# EasyEDA Pro project esp32‑smart‑greenhouse.epro

# Schematic schematic1_1
Board Name: Board1; Create Date: 2025-07-08; Page Name: P1; Project Name: ESP32-01-V1.05; Schematic Name: schematic1_1; Update Date: 2025-07-08; Company: 嘉立创EDA; Page Size: A4; Version: V1.0
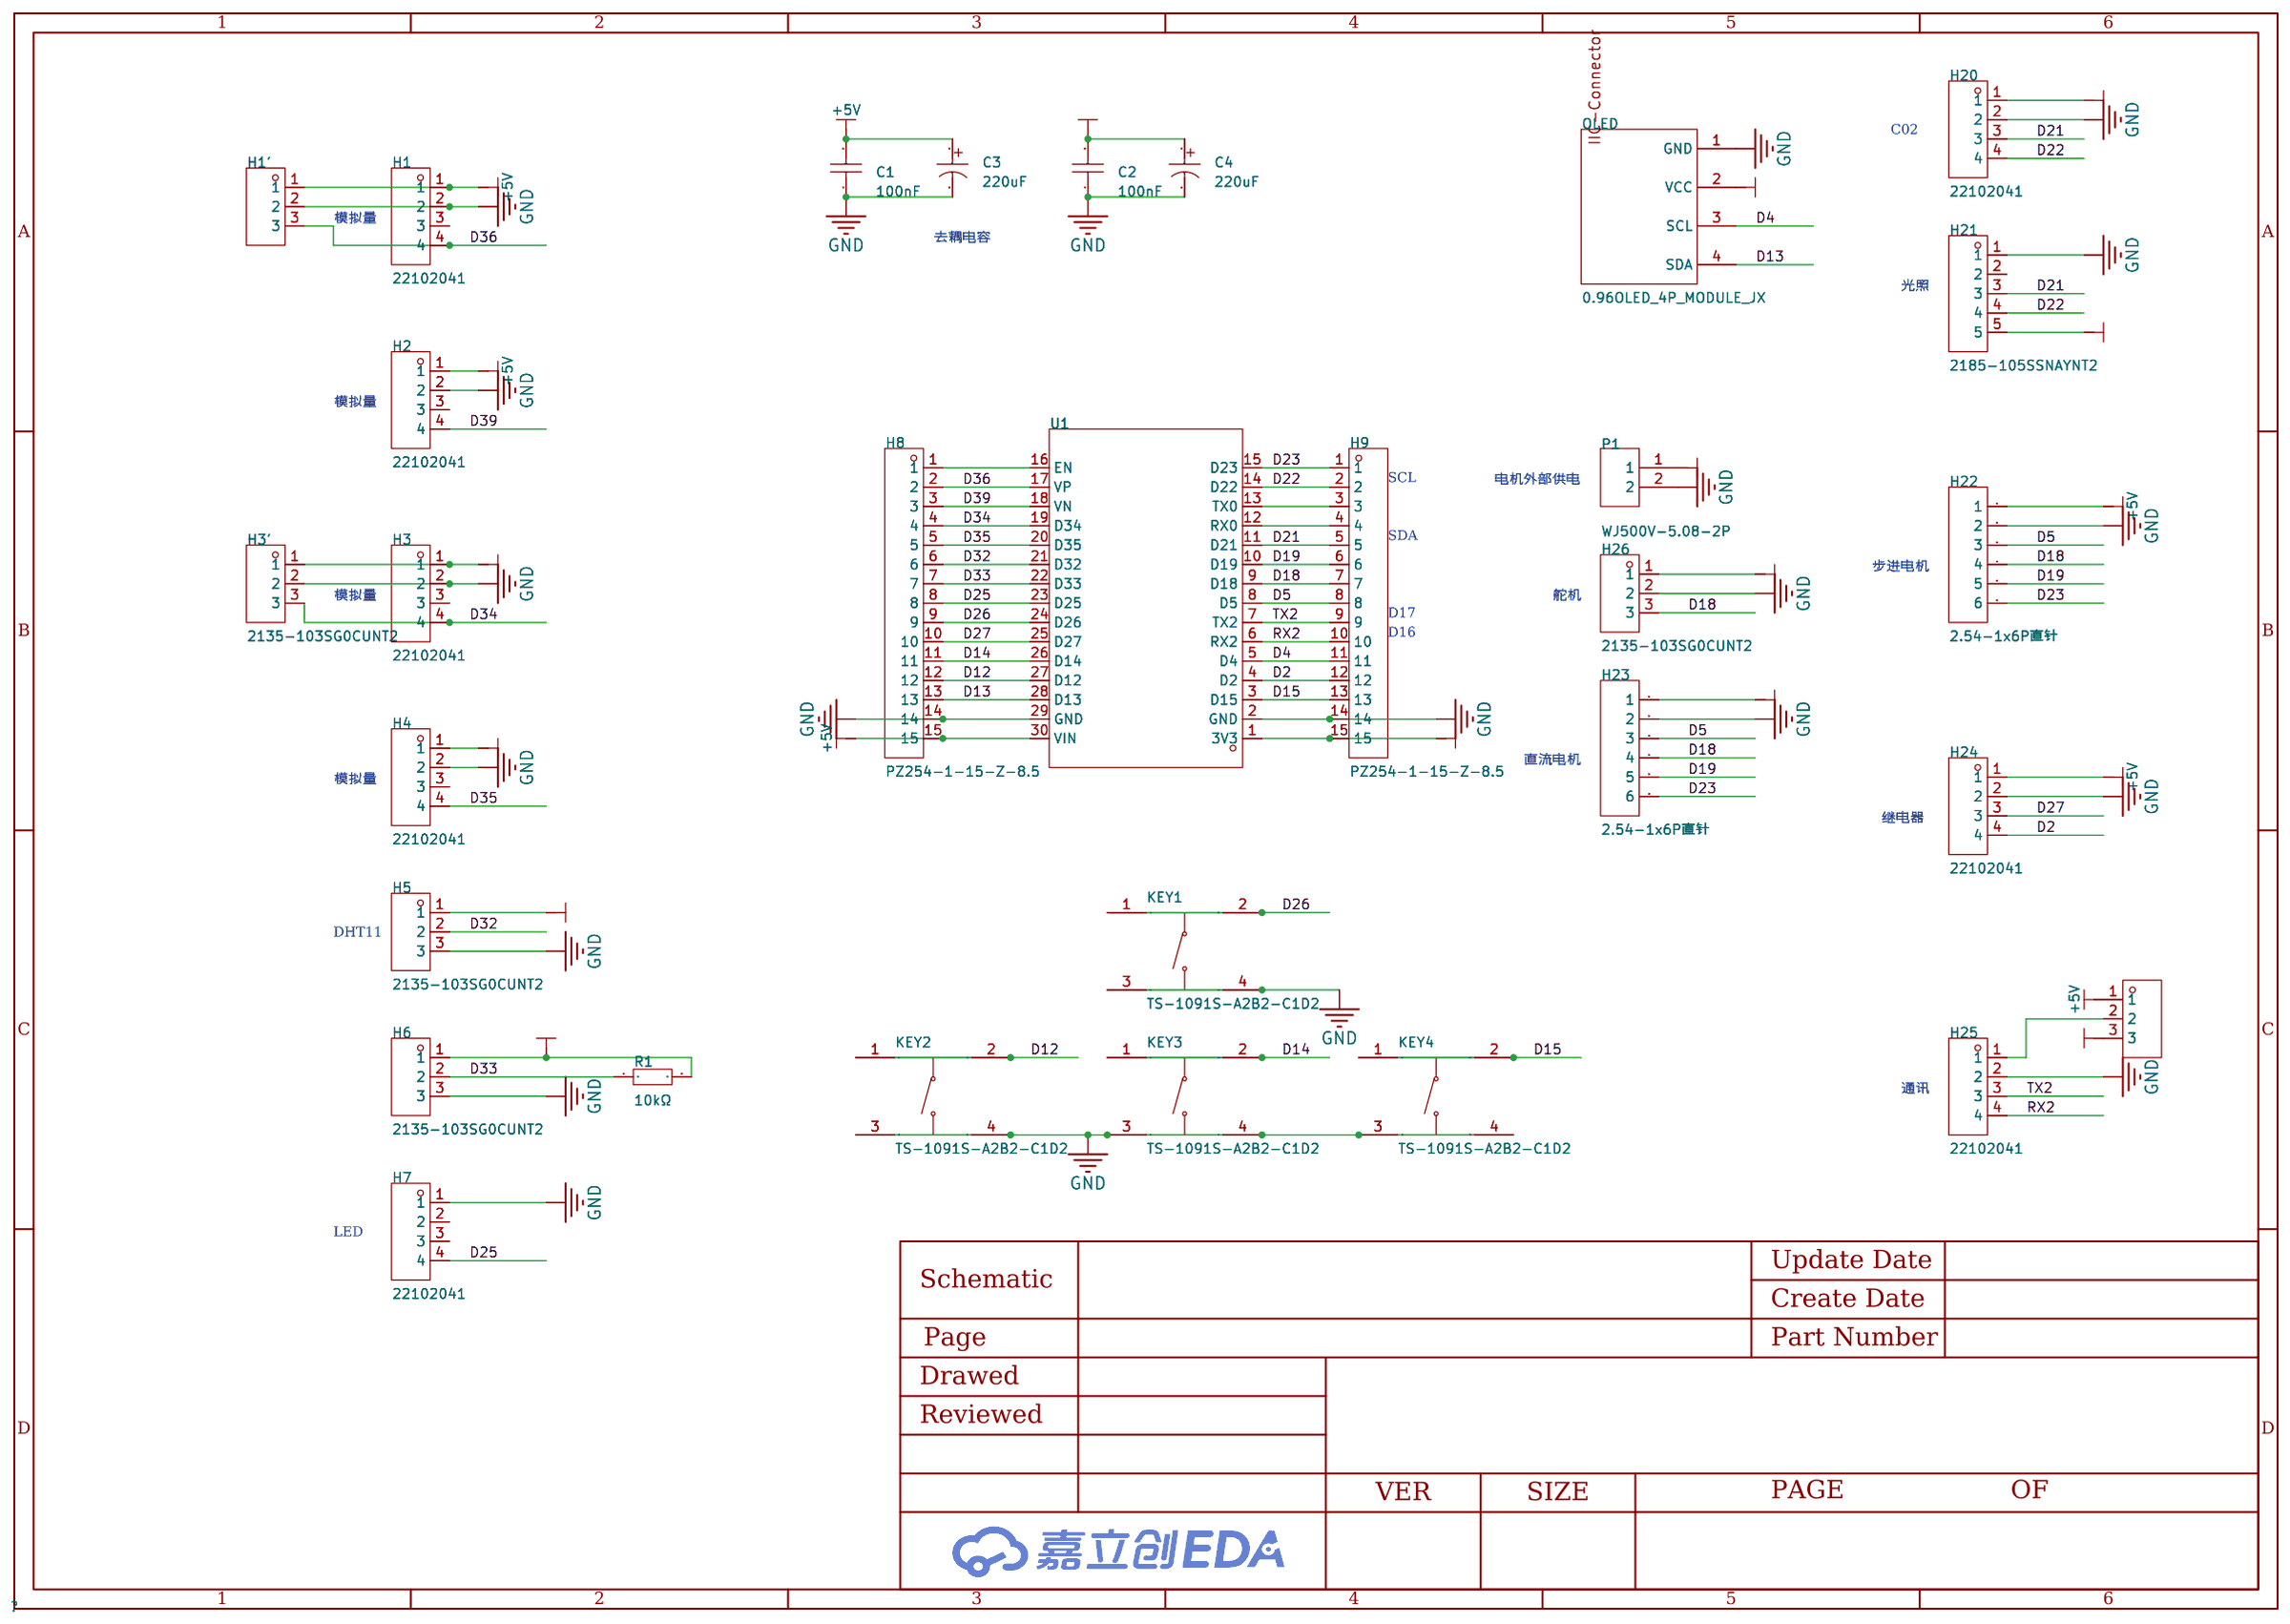
[diagram p0: schematic sheet]

## Parts
C1  100nF  [C0805]
C2  100nF  [C0805]
C3  220uF  [CAP-TH_BD6.3-P2.50-D1.0-FD]
C4  220uF  [CAP-TH_BD6.3-P2.50-D1.0-FD]
H1  22102041  [HDR-TH_4P-P2.54-V-M]
H1'  2135-103SG0CUNT2  [HDR-TH_3P-P2.54-V-F]
H2  22102041  [HDR-TH_4P-P2.54-V-M]
H3  22102041  [HDR-TH_4P-P2.54-V-M]
H3'  2135-103SG0CUNT2  [HDR-TH_3P-P2.54-V-F]
H4  22102041  [HDR-TH_4P-P2.54-V-M]
H5  2135-103SG0CUNT2  [HDR-TH_3P-P2.54-V-F]
H6  2135-103SG0CUNT2  [HDR-TH_3P-P2.54-V-F]
H7  22102041  [HDR-TH_4P-P2.54-V-M]
H8  PZ254-1-15-Z-8.5  [HDR-TH_15P-P2.54-V-M]
H9  PZ254-1-15-Z-8.5  [HDR-TH_15P-P2.54-V-M]
H20  22102041  [HDR-TH_4P-P2.54-V-M]
H21  2185-105SSNAYNT2  [HDR-TH_5P-P2.54-V-F]
H22  2.54-1x6P直针  [HDR-TH_6P-P2.54-V-M-1]
H23  2.54-1x6P直针  [HDR-TH_6P-P2.54-V-M-1]
H24  22102041  [HDR-TH_4P-P2.54-V-M]
H25  22102041  [HDR-TH_4P-P2.54-V-M]
H26  2135-103SG0CUNT2  [HDR-TH_3P-P2.54-V-F]
H27  2135-103SG0CUNT2  [HDR-TH_3P-P2.54-V-F]
KEY1  TS-1091S-A2B2-C1D2  [SW-SMD_4P-L4.5-W4.5-P3.00-LS6.8]
KEY2  TS-1091S-A2B2-C1D2  [SW-SMD_4P-L4.5-W4.5-P3.00-LS6.8]
KEY3  TS-1091S-A2B2-C1D2  [SW-SMD_4P-L4.5-W4.5-P3.00-LS6.8]
KEY4  TS-1091S-A2B2-C1D2  [SW-SMD_4P-L4.5-W4.5-P3.00-LS6.8]
OLED  0.96OLED_4P_MODULE_JX  [0.96 OLED IIC]
P1  WJ500V-5.08-2P  [CONN-TH_2P-P5.00_WJ500V-5.08-2P]
R1  10kΩ  [R0805]
U1  -  [ESP32-DEVKIT]

## Library data of the parts
C1 C2 = 0805B104K500NT: 容值:100nF;精度:±10%;额定电压:50V;材质(温度系数):X7R;; LCSC Part Name: 100nF ±10% 50V; Supplier Part: C38141; Manufacturer: FH(风华); Supplier Footprint: 0805; JLCPCB Part Class: 扩展库; Datasheet: https://atta.szlcsc.com/upload/public/pdf/source/20200305/C486355_26A10D38EF8C2A5C37091D0039909270.pdf; Supplier: LCSC; Tolerance: ±10%; Voltage Rated: 50V; Temperature Coefficient: X7R
C3 C4 = KM227M025E11RR0VH2FP0: 容值:220uF;精度:±20%;额定电压:25V;纹波电流:-;等效串联电阻:-;; LCSC Part Name: 220uF ±20% 25V; Supplier Part: C12450; Manufacturer: CX(承兴); Supplier Footprint: 插件,D6.3xL11mm; JLCPCB Part Class: Extended Part; Datasheet: https://atta.szlcsc.com/upload/public/pdf/source/20211027/06D6BA3719C264B639DC286D935D03EA.pdf; Supplier: LCSC; Tolerance: ±20%; Rated Voltage: 25V; φD: 6.3mm; L: 11mm; Lead Spacing: 2.5mm; Lifetime @ Temp: 1000hrs@105℃
H1-H4 H7 H20 H24 H25 = 22102041: 间距:2.54mm;总PIN位数:4;排数:1;插针结构:1x4P;行距:-;安装类型:直插;圆针/方针:方针;额定电流:-;额定电压:-;配合针长度:7.49mm;塑高:3.3mm;端接针长度:3.43mm;触头材质:-;工作温度范围:-;颜色:-;; LCSC Part Name: 2.54mm 1x4P 直插 方针; Supplier Part: C587009; Manufacturer: MOLEX; Supplier Footprint: 直插,P=2.54mm; JLCPCB Part Class: Extended Part; Datasheet: https://atta.szlcsc.com/upload/public/pdf/source/20200402/C505002_856223BAA9A0A89C9E5E2B091B4C4B1A.pdf; Supplier: LCSC; Pitch: 2.54mm; Number of Pins: 4; Number of Rows: 1; Pin Structure: 1x4P; Mounting Type: 直插; Circluar Pins/Square Pins: 方针; Length of Mating Pin: 7.49mm; Insulation Height: 3.3mm; Length of End Connection Pin: 3.43mm
H1' H3' H5 H6 H26 H27 = 2135-103SG0CUNT2: 间距:2.54mm;总孔位数:3;排数:1;插孔结构:1x3P;行距:2.54mm;安装类型:直插;圆孔/方孔:方孔;额定电流:3A;额定电压:320V;插孔方向:顶部;塑高:3.55mm;触头材质:磷青铜;触头镀层:金;工作温度范围:-40℃~+105℃;焊接温度(最大值):-;; LCSC Part Name: 2.54mm 1x3P; Supplier Part: C721782; Manufacturer: Wcon(维峰电子); Supplier Footprint: 直插,P=2.54mm; JLCPCB Part Class: Extended Part; Datasheet: https://atta.szlcsc.com/upload/public/pdf/source/20200831/C721782_AFAF4F918CF4AB6BFC0BAFDF09758928.pdf; Supplier: LCSC; Pitch: 2.54mm; Number of Holes: 3; Number of Rows: 1; Holes Structure: 1x3P; Row Spacing: 2.54mm; Mounting Type: 直插; Circular Hole / Square Hole: 方孔; Current Rating (Max): 3A; Voltage Rating (Max): 320V; Holes Direction: 顶部; Insulation Height: 3.55mm; Contact Material: 磷青铜; Contact Plating: 金; Operating Temperature Range: -40℃~+105℃
H8 H9 = PZ254-1-15-Z-8.5_C2894938: 排数:单排;总PIN位数:15;间距:2.54mm;插针结构:1x15P;行距:-;安装类型:直插;圆针/方针:方针;额定电流:3A;额定电压:-;配合针长度:6mm;塑高:2.5mm;端接针长度:3mm;触头材质:-;工作温度范围:-40℃~+105℃;颜色:黑色;; LCSC Part Name: 2.54mm 1x15P 直插 方针; Supplier Part: C2894938; Manufacturer: HCTL(华灿天禄); Supplier Footprint: 插件,P=2.54mm; JLCPCB Part Class: Extended Part; Datasheet: https://atta.szlcsc.com/upload/public/pdf/source/20210915/C60D3389AEF9552CB6A0EAA67D6CA963.pdf; Supplier: LCSC; Number of Rows: 单排; Number of Pins: 15; Pitch: 2.54mm; Pin Structure: 1x15P; Mounting Type: 直插; Circluar Pins/Square Pins: 方针; Current Rating (Max): 3A; Length of Mating Pin: 6mm; Insulation Height: 2.5mm; Length of End Connection Pin: 3mm; Operating Temperature Range: -40℃~+105℃; Color: 黑色
H21 = 2185-105SSNAYNT2: 间距:2.54mm;总孔位数:5;排数:1;插孔结构:1x5P;行距:2.54mm;安装类型:直插;圆孔/方孔:方孔;额定电流:3A;额定电压:320V;插孔方向:顶部;塑高:8.5mm;触头材质:磷青铜;触头镀层:锡;工作温度范围:-40℃~+105℃;焊接温度(最大值):-;; LCSC Part Name: 2.54mm 1x5P; Supplier Part: C721789; Manufacturer: Wcon(维峰电子); Supplier Footprint: 直插,P=2.54mm; JLCPCB Part Class: Extended Part; Datasheet: https://atta.szlcsc.com/upload/public/pdf/source/20200814/C721789_B69A641D65EF4F3EE83CD5D7BC85F3DA.pdf; Supplier: LCSC; Pitch: 2.54mm; Number of Holes: 5; Number of Rows: 1; Holes Structure: 1x5P; Row Spacing: 2.54mm; Mounting Type: 直插; Circular Hole / Square Hole: 方孔; Current Rating (Max): 3A; Voltage Rating (Max): 320V; Holes Direction: 顶部; Insulation Height: 8.5mm; Contact Material: 磷青铜; Contact Plating: 锡; Operating Temperature Range: -40℃~+105℃
H22 H23 = 2.54-1x6P直针: 排数:单排;总PIN位数:6;间距:2.54mm;插针结构:1x6P;行距:-;安装类型:直插;圆针/方针:方针;额定电流:3A;额定电压:-;配合针长度:-;塑高:-;触头材质:黄铜;触头镀层:-;工作温度范围:-40℃~+105℃;颜色:黑色;; LCSC Part Name: 2.54mm 1x6P 直插 方针; Supplier Part: C37208; Manufacturer: BOOMELE(博穆精密); Supplier Footprint: 直插,P=2.54mm; JLCPCB Part Class: Extended Part; Datasheet: https://atta.szlcsc.com/upload/public/pdf/source/20151109/1457707558014.pdf; Supplier: LCSC; Number of Rows: 单排; Number of Pins: 6; Pitch: 2.54mm; Pin Structure: 1x6P; Mounting Type: 直插; Circluar Pins/Square Pins: 方针; Current Rating (Max): 3A; Contact Material: 黄铜; Operating Temperature Range: -40℃~+105℃; Color: 黑色
KEY1-KEY4 = TS-1091S-A2B2-C1D2: 触点电流:50mA;额定电压(DC):12V;绝缘电阻:100MΩ;电路结构:单刀单掷;作用力:180gf@±30gf;机械寿命:10万次;; LCSC Part Name: 轻触开关4.5*4.5*3.8贴片四脚正按圆柄按键180gf; Supplier Part: C2972104; Manufacturer: Yuandi(元迪); Supplier Footprint: SMD; JLCPCB Part Class: 扩展库; Datasheet: https://atta.szlcsc.com/upload/public/pdf/source/20220124/E36CE55B63FCC09C1B6C7E045CBF9EE5.pdf; Supplier: LCSC; Contact Current: 50mA; Voltage Rating (DC): 12V; Insulation Resistance: 100MΩ; Circuit: 单刀单掷; Actuator Style: 圆形按钮; Actuator/Cap Color: 黑色; Operating Force: 180gf@±30gf; Mechanical Life: 10万次; Operating Temperature: -25℃~+85℃; Switch Length: 4.5mm; Switch Width: 4.5mm; Switch Height: 3.8mm
OLED = 0.96OLED_4P_MODULE_JX: Supplier Part: C9900004566; Supplier Footprint: 插件; JLCPCB Part Class: Extended Part; Datasheet: https://atta.szlcsc.comnull; Supplier: LCSC
P1 = WJ500V-5.08-2P: 间距:5.08mm;结构:1x2P;排数:1;每排PIN数:2;安装方式:直针;额定电流:18A;额定电压:250V;线规 - AWG:14~30;线规 - mm2:2.5;工作温度范围:-40℃~+105℃;颜色:绿色;; LCSC Part Name: 5.08mm 1x2P 排数:1 每排P数:2 直针 可拼接; Supplier Part: C8465; Manufacturer: KANGNEX(康奈克斯电气); Supplier Footprint: 插件,P=5.08mm; JLCPCB Part Class: Extended Part; Datasheet: https://atta.szlcsc.com/upload/public/pdf/source/20191225/C8465_02D34CE5B5B4A53DF5891601D97FA9F4.pdf; Supplier: LCSC; Pitch: 5.08mm; Structure: 1x2P; Number of Rows: 1; Number of PINs Per Row: 2; Mounting Style: 直针; Current Rating (Max): 18A; Voltage Rating (Max): 250V; Wire Gauge - AWG: 14~30; Wire Gauge - mm2: 2.5; Operating Temperature Range: -40℃~+105℃; Color: 绿色
R1 = 0805W8F1002T5E_C17414: 电阻类型:厚膜电阻;阻值:10kΩ;精度:±1%;功率:125mW;最大工作电压:150V;温度系数:±100ppm/℃;; LCSC Part Name: 10kΩ ±1% 125mW 厚膜电阻; Supplier Part: C17414; Manufacturer: UNI-ROYAL(厚声); Manufacturer Part: 0805W8F1002T5E; Supplier Footprint: 0805; JLCPCB Part Class: 基础库; Datasheet: https://atta.szlcsc.com/upload/public/pdf/source/20200306/C422600_1E6D84923E4A46A82E41ADD87F860B5C.pdf; Supplier: LCSC; Type: 厚膜电阻; Tolerance: ±1%; Power(Watts): 125mW; Overload Voltage (Max): 150V; Temperature Coefficient: ±100ppm/℃; Operating Temperature Range: -55℃~+155℃
U1 = ESP32

## Nets
3.3V: C2.2 C4.1 H3.1 H3'.1 H4.1 H5.1 H6.1 H9.15 H20.1 H21.5 H27.3 OLED.2(VCC) R1.2 U1.1(3V3)
+5V: C1.2 C3.1 H1.1 H1'.1 H2.1 H8.15 H22.1 H24.1 H27.1 U1.30(VIN)
GND: C1.1 C2.1 C3.2 C4.2 H1.2 H1'.2 H2.2 H3.2 H3'.2 H4.2 H5.3 H6.3 H7.1 H8.14 H9.14 H20.2 H21.1 H22.2 H23.2 H24.2 H25.2 H26.2 KEY1.3 KEY1.4 KEY2.3 KEY2.4 KEY3.3 KEY3.4 KEY4.3 KEY4.4 OLED.1(GND) P1.2 U1.2(GND) U1.29(GND)
VCC5: H23.1 H26.1 P1.1
D2: H9.12 H24.4 U1.4(D2)
D4: H9.11 OLED.3(SCL) U1.5(D4)
D5: H9.8 H22.3 H23.3 U1.8(D5)
D12: H8.12 KEY2.1 KEY2.2 U1.27(D12)
D13: H8.13 OLED.4(SDA) U1.28(D13)
D14: H8.11 KEY3.1 KEY3.2 U1.26(D14)
D15: H9.13 KEY4.1 KEY4.2 U1.3(D15)
D18: H9.7 H22.4 H23.4 H26.3 U1.9(D18)
D19: H9.6 H22.5 H23.5 U1.10(D19)
D21: H9.5 H20.3 H21.3 U1.11(D21)
D22: H9.2 H20.4 H21.4 U1.14(D22)
D23: H9.1 H22.6 H23.6 U1.15(D23)
D25: H7.4 H8.8 U1.23(D25)
D26: H8.9 KEY1.1 KEY1.2 U1.24(D26)
D27: H8.10 H24.3 U1.25(D27)
D32: H5.2 H8.6 U1.21(D32)
D33: H6.2 H8.7 R1.1 U1.22(D33)
D34: H3.4 H3'.3 H8.4 U1.19(D34)
D35: H4.4 H8.5 U1.20(D35)
D36: H1.4 H1'.3 H8.2 U1.17(VP)
D39: H2.4 H8.3 U1.18(VN)
RX2: H9.10 H25.4 U1.6(RX2)
TX2: H9.9 H25.3 U1.7(TX2)
$1N1952: H9.4 U1.12(RX0)
$1N1955: H9.3 U1.13(TX0)
$1N2002: H8.1 U1.16(EN)
$1N5337: H25.1 H27.2

Not connected (* = marked no-connect by the designer): H1 3; H2 3; H3 3; H4 3; H7 2 3; H21 2

## Notes on the sheet
- C02
- 模拟量
- 去耦电容
- 光照
- 模拟量
- SCL
- 电机外部供电
- SDA
- 步进电机
- 模拟量
- 舵机
- D17
- D16
- 直流电机
- 模拟量
- 继电器
- DHT11
- 通讯
- LED

# Board PCB1
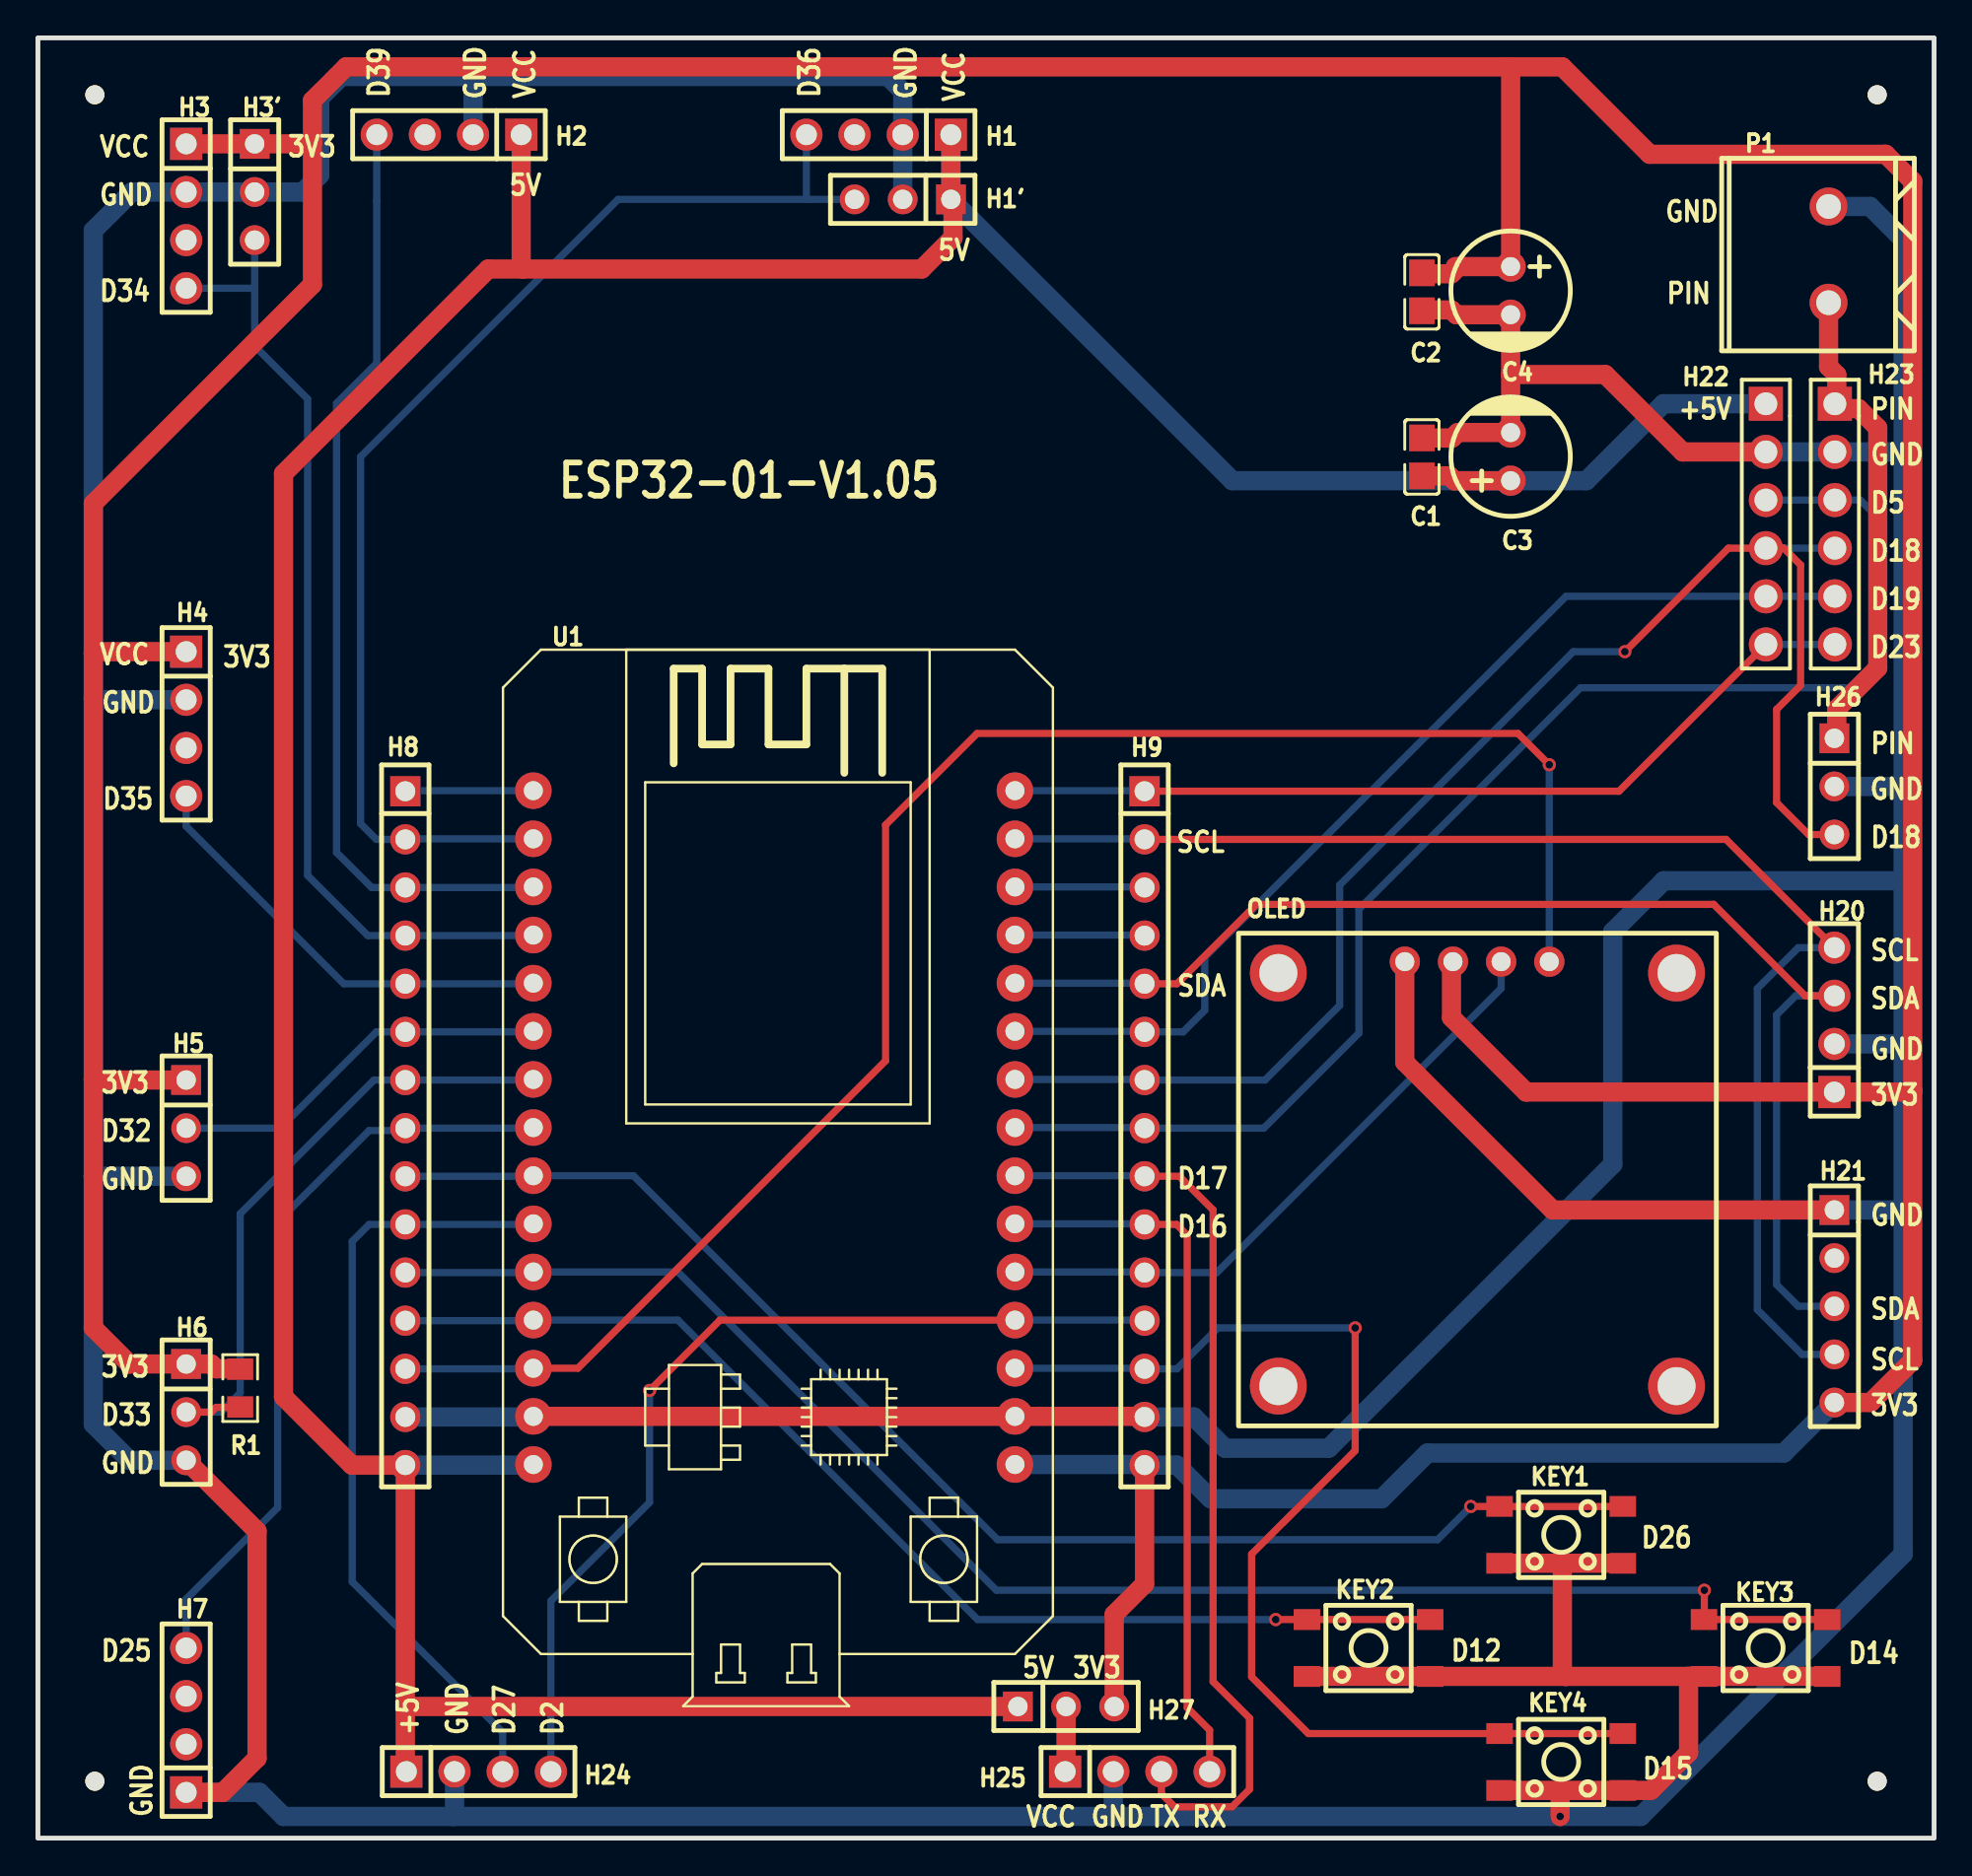
[diagram p1: board, top side]
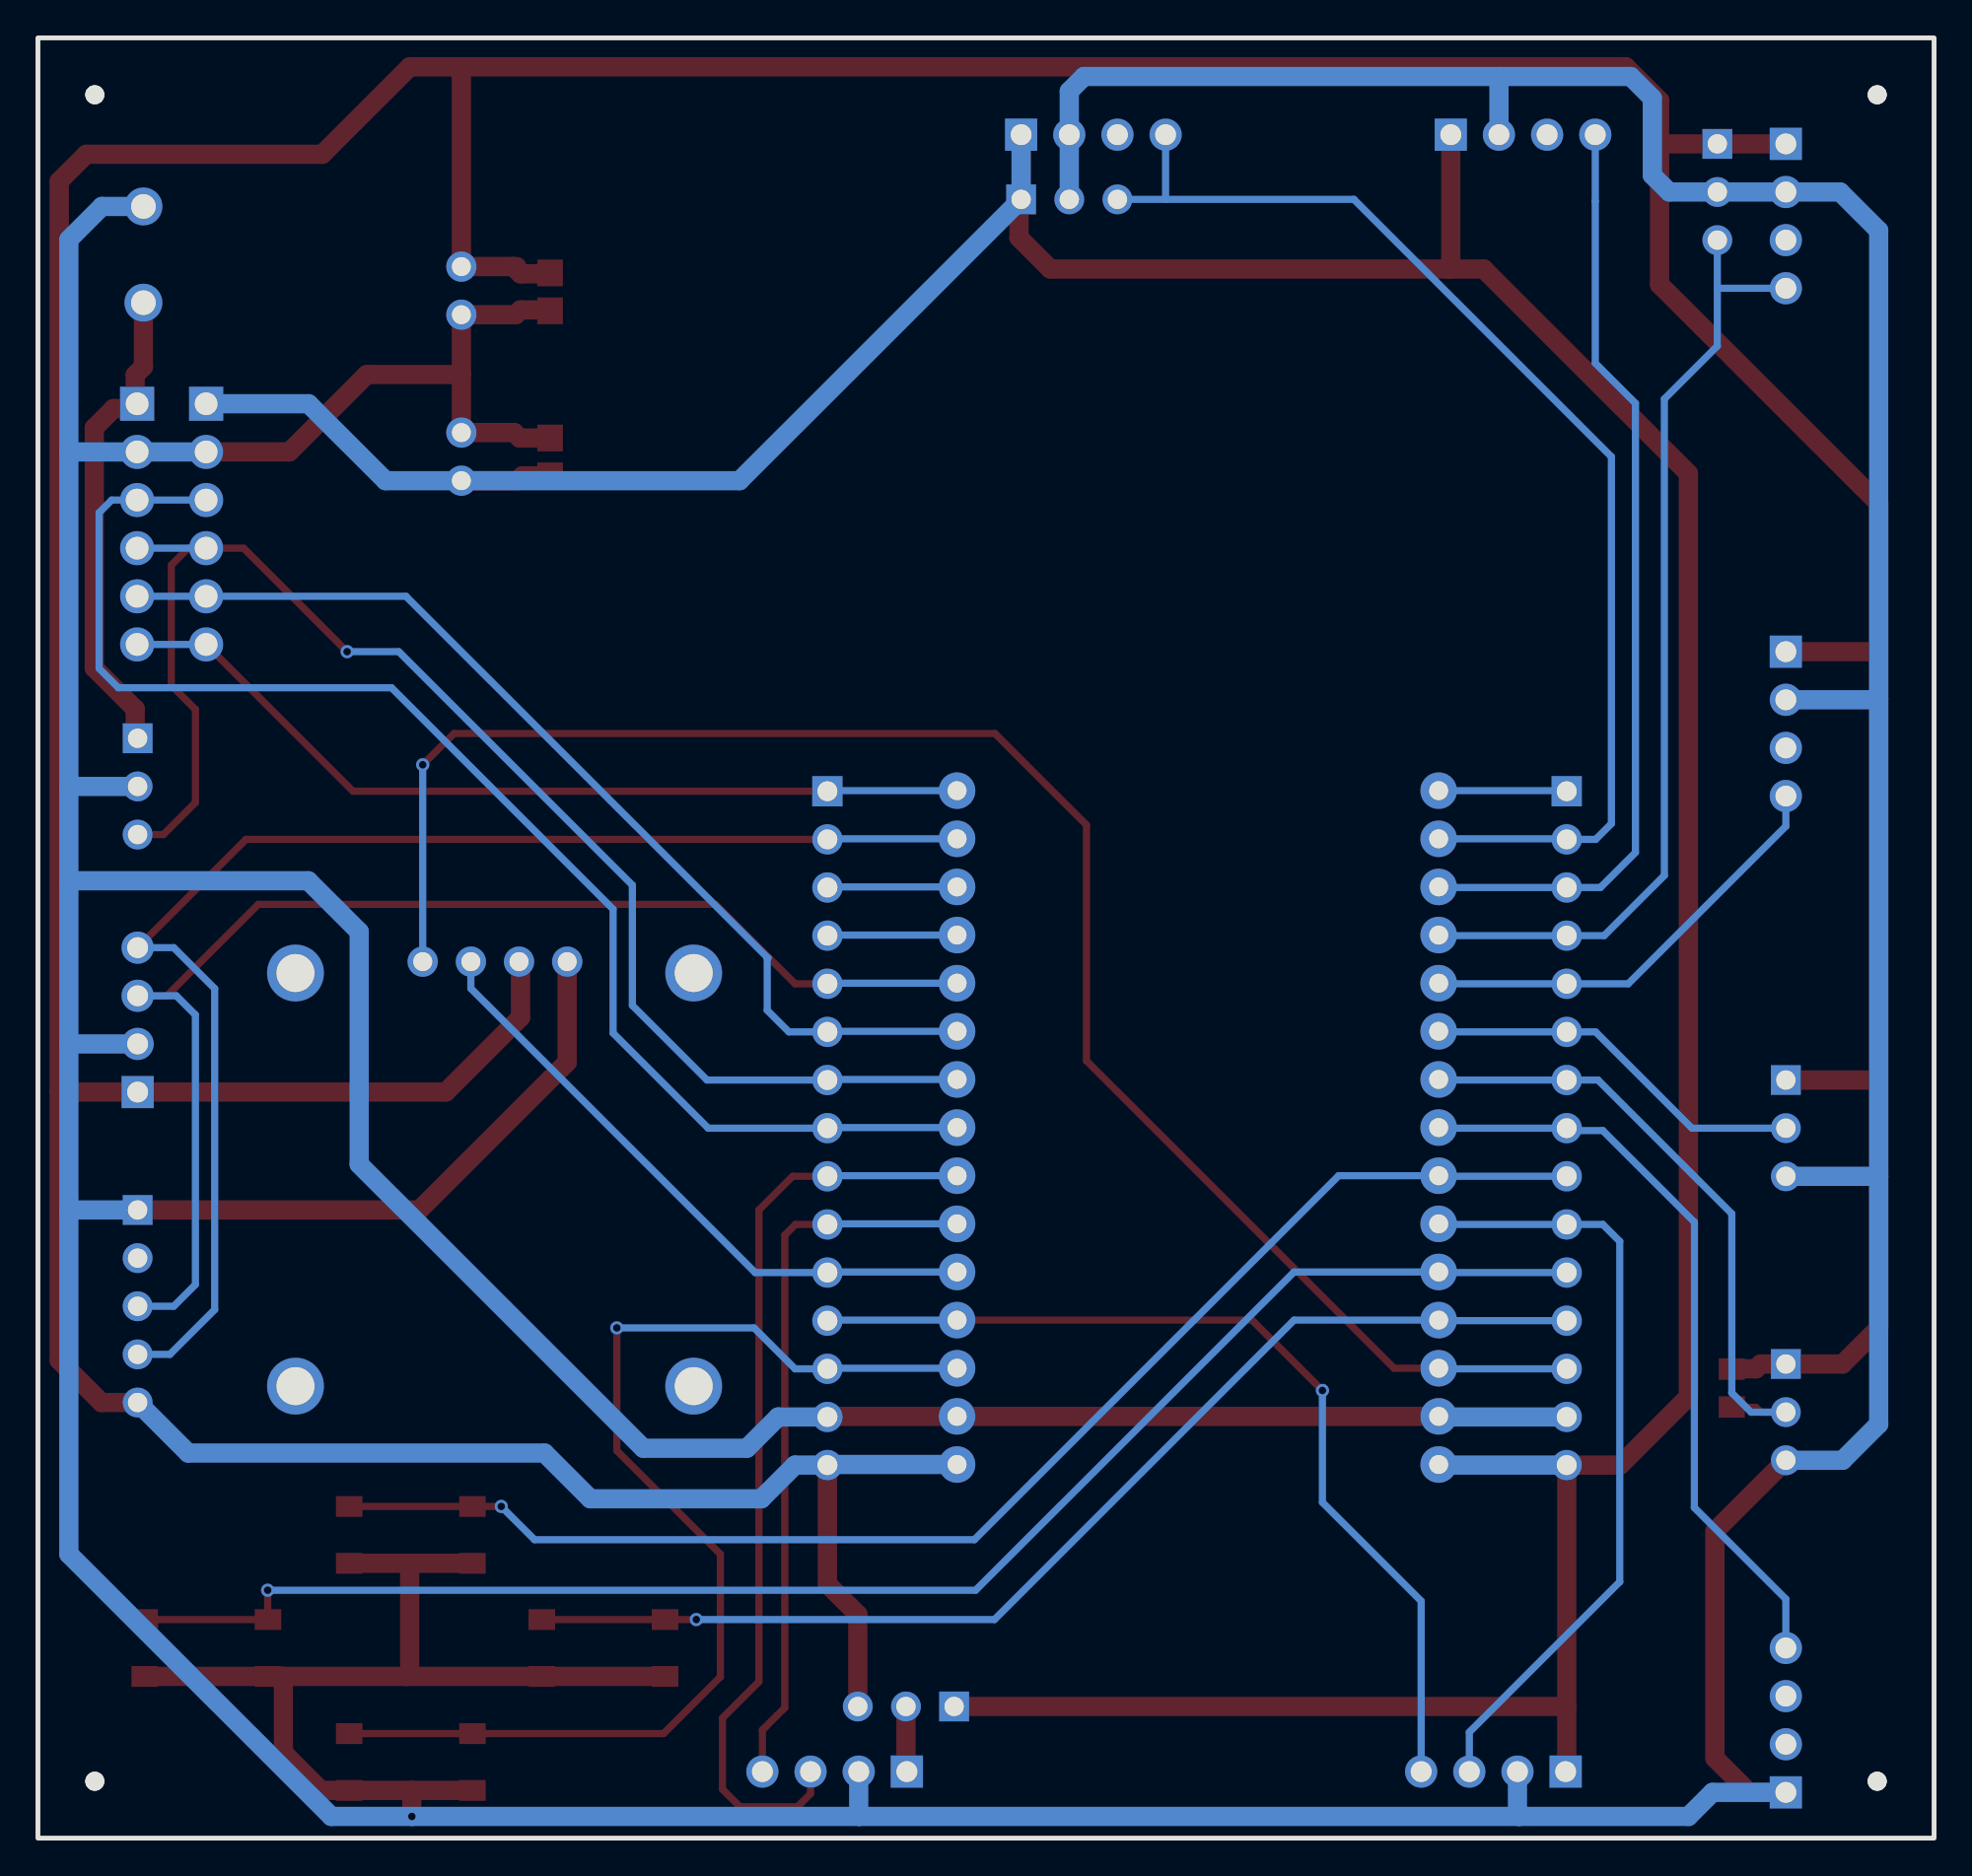
[diagram p2: board, bottom side, seen from below]

Outline 100 x 95 mm; copper layers: Top Layer, Bottom Layer. Coordinates in mm from the lower left corner of the outline.
Outline path: rectangle 0,95 100,0
Stack: Top Layer 0.035mm / Dielectric1 1.51mm FR4 er 4.5 / Bottom Layer 0.035mm

## Design rules (mm)
template: JLCPCB Capability(Two Layers Board)
spacing copperThickness1oz (default): track to track 0.102, other pairs 0.152 to 0.3
spacing copperThickness2oz: track to track 0.203, other pairs 0.152 to 0.3
track width copperThickness1oz (default): min 0.127, default 0.254, max 2.54
track width copperThickness2oz: min 0.203, default 0.254, max 2.54
differential pair differentialPair (default): width min 0.127, default 0.254, max 2.54; gap min 0.152, default 0.152
via viaSize (default): diameter min 0.5, default 0.61, max 10; hole min 0.3, default 0.305, max 6.3

## Placement (name value [footprint] x y rotation side)
C1  100nF  [C0805]  72.99 72.89 270 top
C2  100nF  [C0805]  72.99 81.6 90 top
C3  220uF  [CAP-TH_BD6.3-P2.50-D1.0-FD]  77.67 72.9 90 top
C4  220uF  [CAP-TH_BD6.3-P2.50-D1.0-FD]  77.67 81.66 270 top
H1  22102041  [HDR-TH_4P-P2.54-V-M]  44.34 89.89 180 top
H1'  2135-103SG0CUNT2  [HDR-TH_3P-P2.54-V-F]  45.61 86.48 180 top
H2  22102041  [HDR-TH_4P-P2.54-V-M]  21.68 89.89 180 top
H3  22102041  [HDR-TH_4P-P2.54-V-M]  7.82 85.6 270 top
H3'  2135-103SG0CUNT2  [HDR-TH_3P-P2.54-V-F]  11.43 86.87 270 top
H4  22102041  [HDR-TH_4P-P2.54-V-M]  7.82 58.8 270 top
H5  2135-103SG0CUNT2  [HDR-TH_3P-P2.54-V-F]  7.82 37.46 270 top
H6  2135-103SG0CUNT2  [HDR-TH_3P-P2.54-V-F]  7.82 22.48 270 top
H7  22102041  [HDR-TH_4P-P2.54-V-M]  7.82 6.22 90 top
H8  PZ254-1-15-Z-8.5  [HDR-TH_15P-P2.54-V-M]  19.37 37.46 270 top
H9  PZ254-1-15-Z-8.5  [HDR-TH_15P-P2.54-V-M]  58.36 37.46 270 top
H20  22102041  [HDR-TH_4P-P2.54-V-M]  94.74 43.18 90 top
H21  2185-105SSNAYNT2  [HDR-TH_5P-P2.54-V-F]  94.74 28.07 270 top
H22  2.54-1x6P直针  [HDR-TH_6P-P2.54-V-M-1]  91.13 69.34 270 top
H23  2.54-1x6P直针  [HDR-TH_6P-P2.54-V-M-1]  94.77 69.34 270 top
H24  22102041  [HDR-TH_4P-P2.54-V-M]  23.24 3.51 0 top
H25  22102041  [HDR-TH_4P-P2.54-V-M]  57.98 3.51 0 top
H26  2135-103SG0CUNT2  [HDR-TH_3P-P2.54-V-F]  94.74 55.5 270 top
H27  2135-103SG0CUNT2  [HDR-TH_3P-P2.54-V-F]  54.22 6.95 0 top
KEY1  TS-1091S-A2B2-C1D2  [SW-SMD_4P-L4.5-W4.5-P3.00-LS6.8]  80.33 16 0 top
KEY2  TS-1091S-A2B2-C1D2  [SW-SMD_4P-L4.5-W4.5-P3.00-LS6.8]  70.17 10.03 0 top
KEY3  TS-1091S-A2B2-C1D2  [SW-SMD_4P-L4.5-W4.5-P3.00-LS6.8]  91.12 10.03 0 top
KEY4  TS-1091S-A2B2-C1D2  [SW-SMD_4P-L4.5-W4.5-P3.00-LS6.8]  80.33 4.02 0 top
NOREF  -  [Pad_e27]  97 3 0 top
NOREF#2  -  [Pad_e29]  3 92 0 top
NOREF#3  -  [Pad_e24]  3 3 0 top
NOREF#4  -  [Pad_e28]  97 92 0 top
OLED  0.96OLED_4P_MODULE_JX  [0.96 OLED IIC]  63.32 47.75 0 top
P1  WJ500V-5.08-2P  [CONN-TH_2P-P5.00_WJ500V-5.08-2P]  94.44 83.57 90 top
R1  10kΩ  [R0805]  10.67 23.75 90 top
U1  -  [esp32-devkit]  24.45 62.48 0 top

## Footprints (pads in the part's own frame, mm; a bottom-side part is the same pattern mirrored in y, then rotated)
0.96 OLED IIC
  round 1.6 hole 1: 1(8.77,-1.5) 2(11.31,-1.5) 3(13.85,-1.5) 4(16.39,-1.5)
  round 3 hole 2: 5(2.1,-2.1) 5(2.1,-23.9) 5(23.1,-2.1) 5(23.1,-23.9)
C0805
  rect 1.41x1.35 smd: 1(-1,0) 2(1,0)
CAP-TH_BD6.3-P2.50-D1.0-FD
  round 1.6 hole 1: 1(-1.27,0) 2(1.27,0)
CONN-TH_2P-P5.00_WJ500V-5.08-2P
  round 2 hole 1.3: 1(-2.54,0) 2(2.54,0)
esp32-devkit
  round 1.931 hole 1x1: 1(27.073,-42.769) 2(27.073,-40.228) 3(27.073,-37.688) 4(27.073,-35.148) 5(27.073,-32.608) 6(27.073,-30.069) 7(27.073,-27.529) 8(27.073,-24.988) 9(27.073,-22.448) 10(27.073,-19.909) 11(27.073,-17.369) 12(27.073,-14.829) 13(27.073,-12.289) 14(27.073,-9.748) 15(27.073,-7.208) 16(1.673,-7.208) 17(1.673,-9.748) 18(1.673,-12.289) 19(1.673,-14.829) 20(1.673,-17.369) 21(1.673,-19.909) 22(1.673,-22.448) 23(1.673,-24.988) 24(1.673,-27.529) 25(1.673,-30.069) 26(1.673,-32.608) 27(1.673,-35.148) 28(1.673,-37.688) 29(1.673,-40.228) 30(1.673,-42.769)
HDR-TH_3P-P2.54-V-F
  rect 1.575x1.575 hole 1.02: 1(-2.54,0)
  round 1.575 hole 1.02: 2(0,0) 3(2.54,0)
HDR-TH_4P-P2.54-V-M
  rect 1.7x1.7 hole 1.1: 1(-3.81,0)
  round 1.7 hole 1.1: 2(-1.27,0) 3(1.27,0) 4(3.81,0)
HDR-TH_5P-P2.54-V-F
  rect 1.575x1.575 hole 1.02: 1(-5.08,0)
  round 1.575 hole 1.02: 2(-2.54,0) 3(0,0) 4(2.54,0) 5(5.08,0)
HDR-TH_6P-P2.54-V-M-1
  rect 1.8x1.8 hole 1.2: 1(-6.35,0)
  round 1.8 hole 1.2: 2(-3.81,0) 3(-1.27,0) 4(1.27,0) 5(3.81,0) 6(6.35,0)
HDR-TH_15P-P2.54-V-M
  rect 1.6x1.6 hole 1.05: 1(-17.78,0)
  round 1.6 hole 1.05: 2(-15.24,0) 3(-12.7,0) 4(-10.16,0) 5(-7.62,0) 6(-5.08,0) 7(-2.54,0) 8(0,0) 9(2.54,0) 10(5.08,0) 11(7.62,0) 12(10.16,0) 13(12.7,0) 14(15.24,0) 15(17.78,0)
Pad_e24
  round 1 hole 3: 31(0,0)
Pad_e27
  round 1 hole 3: 31(0,0)
Pad_e28
  round 1 hole 3: 31(0,0)
Pad_e29
  round 1 hole 3: 31(0,0)
R0805
  rect 1.133x1.377 smd: 1(-1,0) 2(1,0)
SW-SMD_4P-L4.5-W4.5-P3.00-LS6.8
  rect 1.4x1.1 smd: 1(-3.25,1.5) 2(3.25,1.5) 3(-3.25,-1.5) 4(3.25,-1.5)

## Nets
As in the schematic.

Pads without a net: H1 3; H2 3; H3 3; H4 3; H7 2 3; H21 2; NOREF 31; NOREF#2 31; NOREF#3 31; NOREF#4 31; OLED 5

## Via types
v1: diameter 0.7, hole 0.4, Top Layer to Bottom Layer, 8 vias

## Routing (per net, layer and track width the routed paths; a pad name or vN(x,y) marks a point on that pad's centre or on a via; arc(x,y) is an arc through that point)
3.3V: length 353.7
  Top Layer w1.016: H3.1 H3'.1 14.41,89.41 14.48,89.48 ; R1.2 10.65,24.76 9.4,24.76 9.14,25.02 H6.1 4.83,25.02 2.92,26.92 2.92,40.02 ; H27.3 56.76,11.8 58.36,13.41 H9.15 ; OLED.2 74.55,46.17 74.55,43.31 78.49,39.37 H20.1 98.81,39.37 98.88,39.43 ; H21.5 96.65,22.99 98.88,25.22 98.88,39.43 ; 98.88,39.43 98.88,87.43 97.45,88.86 85,88.86 80.39,93.47 77.48,93.47 ; 2.92,62.52 2.92,40.02 ; 2.92,62.52 3.01,62.61 H4.1 ; 2.92,62.52 2.92,70.43 14.48,81.99 14.48,89.48 ; 2.92,40.02 2.94,40 H5.1 ; 14.48,89.48 14.48,91.69 16.26,93.47 77.48,93.47 ; C2.2 73.04,82.55 74.55,82.55 74.93,82.93 ; 77.48,93.47 77.67,93.28 C4.1 74.93,82.93 ; 74.93,82.93 74.75,82.93
  Bottom Layer w1.016: U1.1 58.33,19.72 H9.15 60.07,19.69 61.85,17.91 70.87,17.91 73.28,20.32 92.08,20.32 H21.5
+5V: length 224
  Top Layer w1.016: H24.1 19.37,3.57 19.37,6.92 ; C1.2 74.45,71.89 74.71,71.63 77.66,71.63 C3.1 ; H1.1 H1'.1 48.26,86.37 48.26,84.45 46.61,82.8 25.57,82.8 ; 25.57,82.8 25.49,82.88 H2.1 ; 25.57,82.8 23.75,82.8 12.95,72.01 12.95,23.29 16.56,19.69 H8.15 19.37,6.92 ; 19.37,6.92 19.4,6.95 H27.1
  Bottom Layer w1.016: H22.1 85.73,75.69 81.67,71.63 C3.1 62.99,71.63 H1'.1 H1.1 ; H8.15 26.1,19.69 U1.30
GND: length 569.3
  Top Layer w1.016: 87.05,8.53 KEY3.3 KEY3.4 ; 87.05,8.53 87.05,4.5 85.07,2.52 KEY4.4 80.28,2.52 ; 87.05,8.53 80.58,8.53 ; OLED.1 72.09,40.94 79.88,33.15 H21.1 ; 80.58,8.53 80.39,8.72 80.39,14.5 ; 80.58,8.53 KEY2.4 KEY2.3 ; H6.3 11.56,16.2 11.56,4.22 9.75,2.41 H7.1 ; 77.67,77.23 C4.2 74.8,80.39 74.55,80.64 73.03,80.64 C2.1 ; 77.67,77.23 82.66,77.23 86.74,73.15 H22.2 ; 77.67,77.23 C3.2 74.88,74.17 74.59,73.89 C1.1 ; U1.29 U1.2 58.33,22.26 H9.14 ; 80.39,14.5 KEY1.4 ; 80.39,14.5 KEY1.3 ; 80.28,2.52 v1(80.28,1.14) ; 80.28,2.52 KEY4.3
  Bottom Layer w0.381: H8.14 19.34,22.19
  Bottom Layer w1.016: U1.29 26.1,22.22 H8.14 ; 22.88,92.96 22.95,92.89 H2.2 ; 22.88,92.96 16,92.96 14.86,91.82 14.86,87.76 13.97,86.87 H3'.2 H3.2 4.95,86.87 2.92,84.84 2.92,60.13 ; 22.88,92.96 44.83,92.96 45.61,92.19 H1.2 H1'.2 ; H5.3 2.92,34.92 2.92,34.93 ; H4.2 2.98,60.07 2.92,60.13 ; 2.92,34.93 2.92,21.84 4.83,19.94 H6.3 ; 2.92,34.93 2.92,60.13 ; 98.37,55.47 98.37,50.52 ; 98.37,55.47 98.34,55.5 H26.2 ; 98.37,55.47 98.37,73.13 ; 98.37,50.52 85.74,50.52 83.06,47.84 83.06,35.56 68.07,20.57 62.61,20.57 60.96,22.22 H9.14 ; 98.37,50.52 98.37,41.93 ; 98.37,33.04 98.26,33.15 H21.1 ; 98.37,33.04 98.37,14.99 84.53,1.14 v1(80.28,1.14) 56.69,1.14 ; 98.37,33.04 98.37,41.93 ; 98.37,73.13 98.37,84.36 96.62,86.11 P1.2 ; 98.37,73.13 98.35,73.15 H23.2 H22.2 ; 56.69,1.14 21.89,1.14 ; 56.69,1.14 56.71,1.16 56.71,3.53 ; 21.89,1.14 21.97,1.22 H24.2 ; 21.89,1.14 12.95,1.14 11.68,2.41 H7.1 ; 98.37,41.93 98.35,41.91 H20.2
VCC5: length 25.7
  Top Layer w1.016: H26.1 94.87,58.17 94.87,59.59 97.03,61.75 97.03,74.42 96.01,75.44 95.02,75.44 H23.1 94.87,75.79 94.87,77.22 94.44,77.65 P1.1
D2: length 49.9
  Top Layer w0.381: U1.4 35.97,27.34 v1(32.26,23.62)
  Bottom Layer w0.381: U1.4 58.33,27.34 H9.12 ; H24.4 27.05,12.51 32.26,17.72 v1(32.26,23.62)
D4: length 33.3
  Bottom Layer w0.381: U1.5 58.33,29.88 H9.11 62.17,29.84 77.17,44.84 OLED.3
D5: length 73.3
  Bottom Layer w0.381: U1.8 58.33,37.5 H9.8 64.65,37.46 69.67,42.48 69.67,49.02 81.35,60.71 95.76,60.71 96.77,61.72 96.77,69.95 96.11,70.61 H23.3 H22.3
D12: length 60.6
  Top Layer w0.381: v1(65.28,11.53) KEY2.1 KEY2.2
  Bottom Layer w0.381: U1.27 33.75,27.34 49.55,11.53 v1(65.28,11.53) ; 26.1,27.3 H8.12 19.34,27.27
D13: length 92.5
  Top Layer w0.381: U1.28 28.48,24.8 44.7,41.02 44.7,53.47 49.53,58.29 78.06,58.29 v1(79.71,56.64)
  Bottom Layer w0.381: OLED.4 v1(79.71,56.64) ; 26.1,24.76 H8.13
D14: length 83.5
  Top Layer w0.381: KEY3.2 KEY3.1 87.88,11.55 v1(87.88,13.08)
  Bottom Layer w0.381: 19.34,29.81 H8.11 26.1,29.84 ; v1(87.88,13.08) 50.55,13.08 33.75,29.88 U1.26
D15: length 60.3
  Top Layer w0.381: v1(69.47,26.92) 69.47,20.45 64.01,14.99 64.01,8.51 67,5.52 KEY4.1 KEY4.2
  Bottom Layer w0.381: U1.3 58.33,24.8 H9.13 60.07,24.76 62.23,26.92 v1(69.47,26.92)
D18: length 77.4
  Top Layer w0.381: v1(83.69,62.61) 89.15,68.07 H22.4 92.08,68.07 92.96,67.18 92.96,60.83 91.69,59.56 91.69,54.64 93.38,52.96 H26.3
  Bottom Layer w0.381: H22.4 94.56,68.07 ; v1(83.69,62.61) 80.97,62.61 68.65,50.29 68.65,43.94 64.71,40 H9.7 58.33,40.04 U1.9
D19: length 54.2
  Bottom Layer w0.381: U1.10 58.33,42.58 H9.6 60.4,42.54 61.54,43.69 61.54,46.39 61.49,46.44 80.59,65.53 H22.5 94.56,65.53
D21: length 67.5
  Top Layer w0.381: H20.3 93.2,44.45 88.38,49.28 64.26,49.28 60.07,45.08 H9.5
  Bottom Layer w0.381: U1.11 58.33,45.12 H9.5 ; H21.3 92.84,28.07 91.69,29.21 91.69,43.45 92.7,44.45 94.05,44.45
D22: length 71.8
  Top Layer w0.381: H20.4 89.03,52.7 H9.2
  Bottom Layer w0.381: U1.14 58.33,52.74 H9.2 ; H20.4 92.84,46.99 90.68,44.83 90.68,27.89 93.04,25.53 94.05,25.53
D23: length 46.3
  Top Layer w0.381: H22.6 83.38,55.24 H9.1
  Bottom Layer w0.381: U1.15 58.33,55.28 H9.1 ; H22.6 94.56,62.99
D25: length 40
  Bottom Layer w0.381: H7.4 7.82,12.61 12.64,17.44 12.64,32.51 17.47,37.34 19.25,37.34 H8.8 26.1,37.46
D26: length 72.9
  Top Layer w0.381: KEY1.2 KEY1.1 v1(75.57,17.5)
  Bottom Layer w0.381: 19.34,34.89 H8.9 26.1,34.92 ; v1(75.57,17.5) 73.81,15.75 50.61,15.75 31.4,34.96 U1.24
D27: length 41.1
  Bottom Layer w0.381: 26.1,32.38 H8.10 17.47,32.38 16.58,31.49 16.58,13.52 24.51,5.59 24.51,3.56
D32: length 20.4
  Bottom Layer w0.381: H5.2 12.77,37.46 17.85,42.54 H8.6 26.1,42.54
D33: length 34.1
  Top Layer w0.381: R1.1 10.65,22.73 9.4,22.73 9.14,22.48 H6.2
  Bottom Layer w0.381: H8.7 19.34,39.97 ; H8.7 26.1,40 ; H8.7 17.72,40 10.67,32.95 10.67,23.49 9.65,22.48 H6.2
D34: length 51.5
  Bottom Layer w0.381: H8.4 17.4,47.62 14.22,50.8 14.22,75.95 11.43,78.74 11.43,81.76 ; H8.4 19.34,47.59 ; H8.4 26.1,47.62 ; H3.4 11.4,81.79 11.43,81.76 ; 11.43,81.76 H3'.3
D35: length 23.4
  Bottom Layer w0.381: H8.5 19.34,45.05 ; H8.5 16.13,45.08 7.82,53.4 H4.4 ; H8.5 26.1,45.08
D36: length 63.9
  Bottom Layer w0.381: H1.4 40.53,86.48 ; U1.17 19.41,52.74 H8.2 17.85,52.7 17.02,53.53 17.02,72.9 30.6,86.48 H1'.3
D39: length 49.8
  Bottom Layer w0.381: H8.3 19.34,50.13 ; H8.3 17.6,50.16 15.75,52.01 15.75,75.72 17.87,77.84 17.87,86.37 ; H8.3 26.1,50.16 ; 17.87,89.81 17.87,86.37 ; 17.87,86.37 17.88,86.38
RX2: length 38.1
  Top Layer w0.381: 61.79,3.53 61.79,5.7 60.61,6.88 60.61,31.82 60.05,32.38 H9.10
  Bottom Layer w0.381: H9.10 58.33,32.42 U1.6
TX2: length 49
  Top Layer w0.381: H25.3 59.25,2.34 59.94,1.65 62.97,1.65 63.9,2.57 63.9,6.33 61.98,8.25 61.98,33.15 60.2,34.92 H9.9
  Bottom Layer w0.381: U1.7 58.33,34.96 H9.9
$1N1952: length 6.8
  Bottom Layer w0.381: H9.4 58.33,47.66 U1.12
$1N1955: length 6.8
  Bottom Layer w0.381: H9.3 58.33,50.2 U1.13
$1N2002: length 6.8
  Bottom Layer w0.381: H8.1 19.41,55.28 U1.16
$1N5337: length 3.5
  Top Layer w1.016: H25.1 54.22,3.56 H27.2

## Text on the board
Top Silkscreen Layer: VCC | GND | D34 | 3V3 | D32 | D33 | D25 | D35 | 5V | TX | SCL | SDA | D17 | D16 | RX | D12 | D26 | D15 | PIN | +5V | D14 | D5 | D18 | D19 | D23 | D27 | D2 | D39 | D36 | ESP32-01-V1.05
